# EasyEDA Pro project ProPrj_STM32学习板_2026-09-11.epro, board PCB1
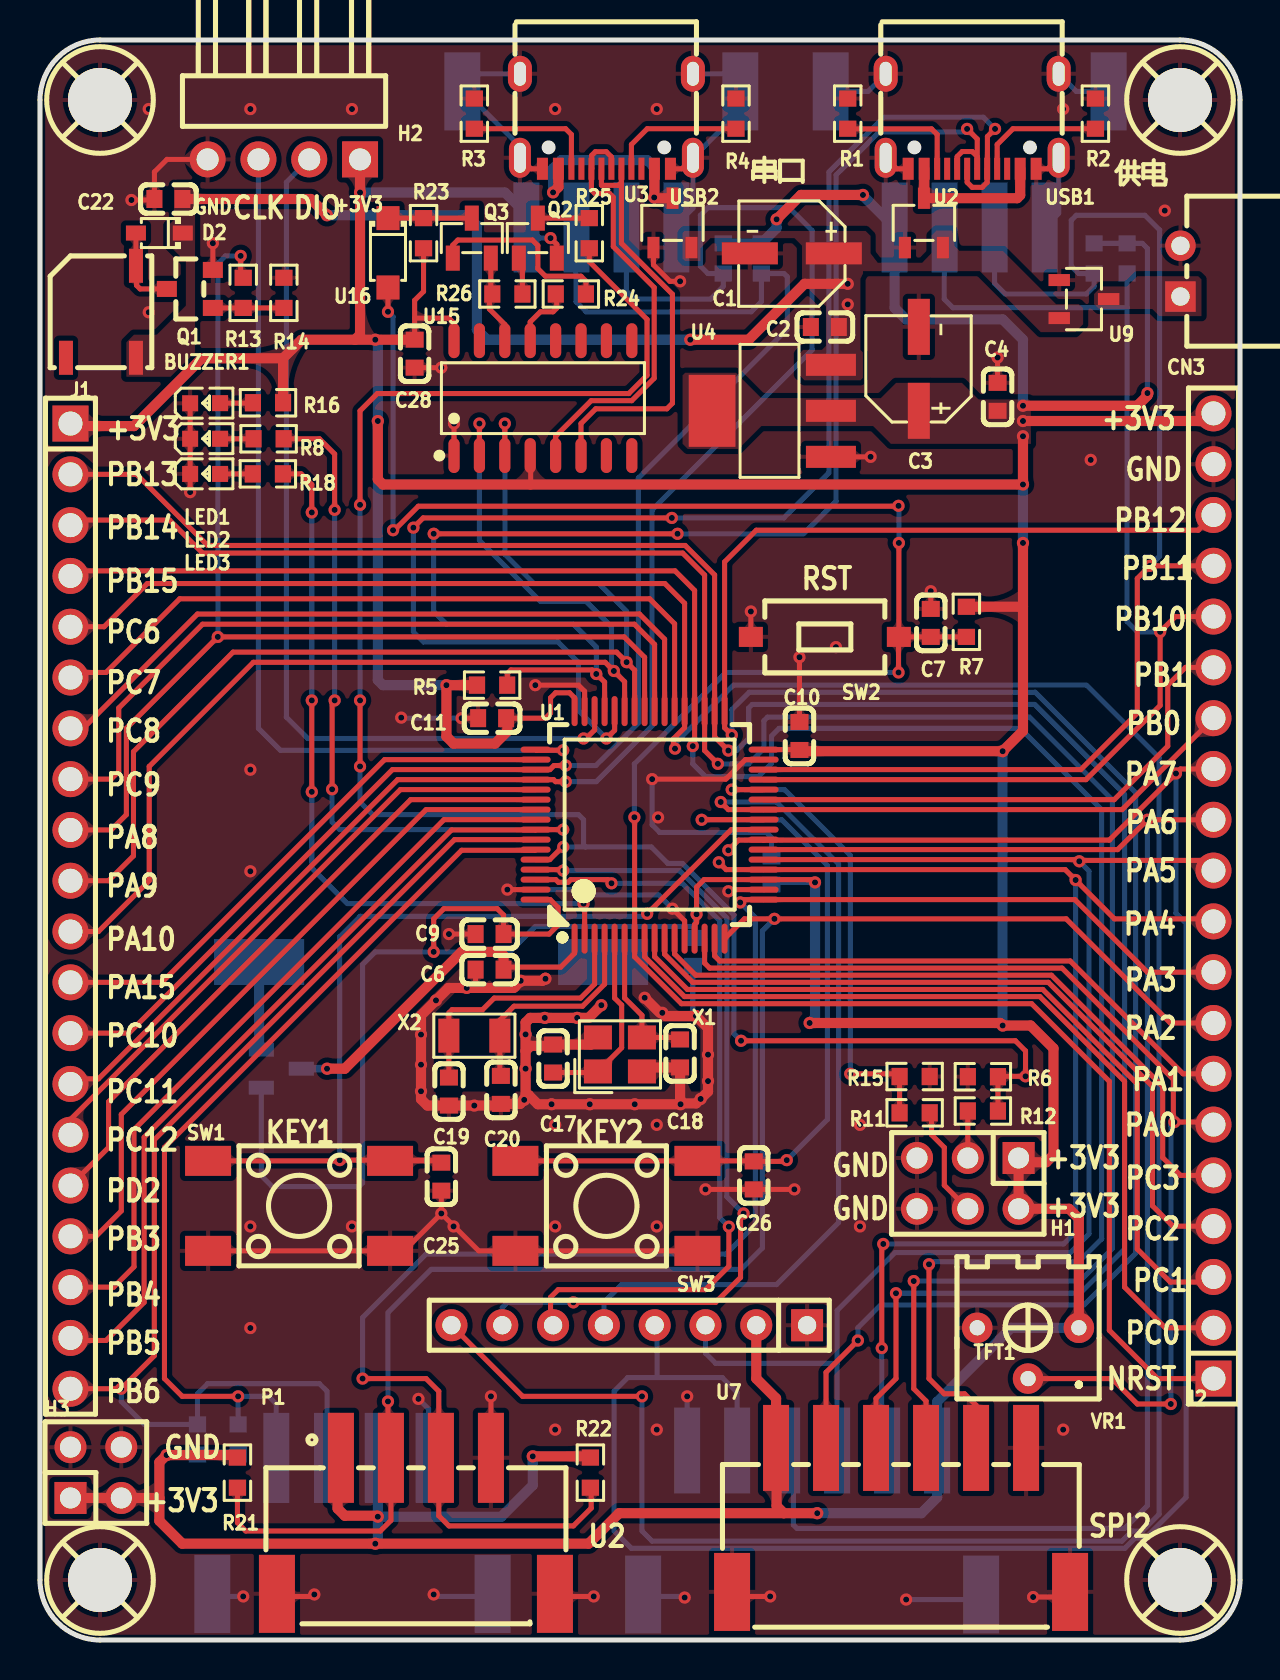
[diagram p3: board, top side]
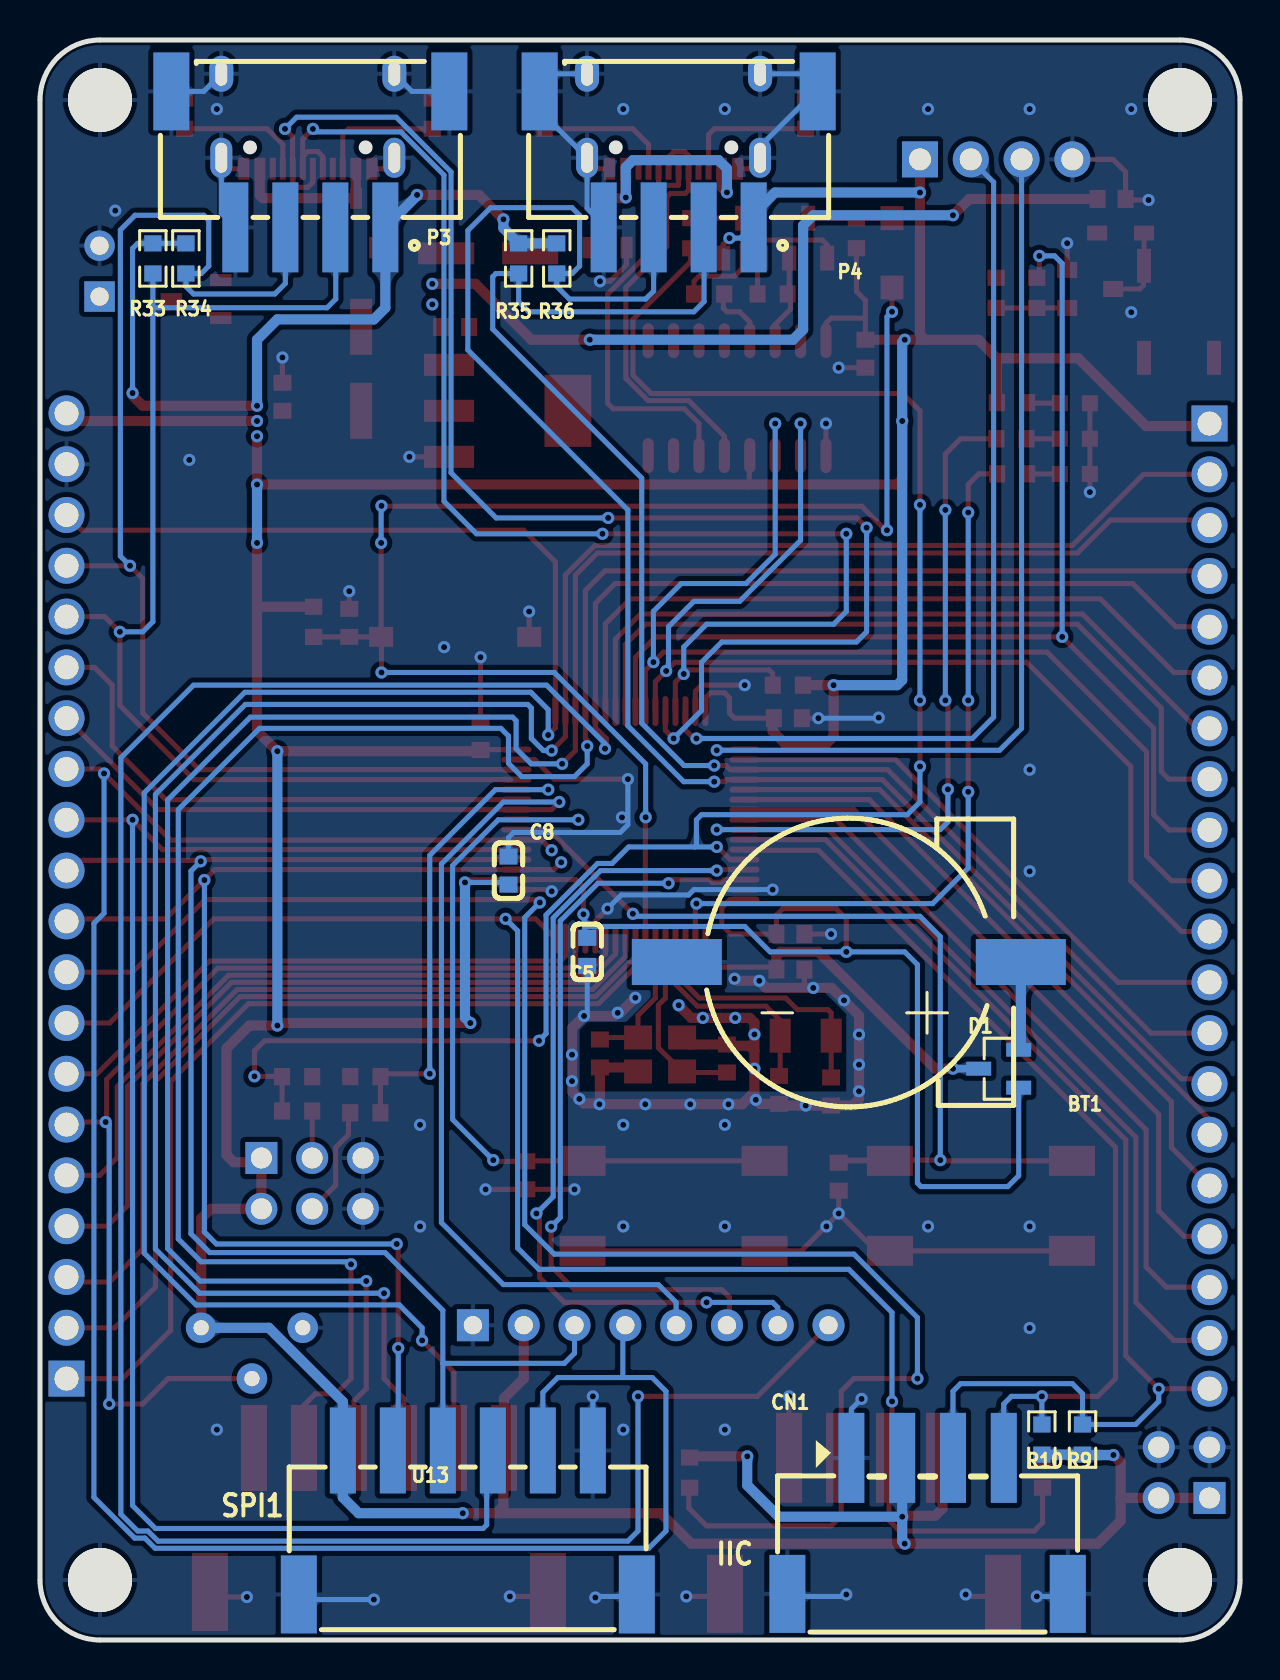
[diagram p4: board, bottom side, seen from below]

Outline 60 x 80 mm; copper layers: Top Layer, Bottom Layer. Coordinates in mm from the lower left corner of the outline.
Outline path: 0,77 0,3 arc(0.88,0.88) 3,0 57,0 arc(59.12,0.88) 60,3 60,77 arc(59.12,79.12) 57,80 3,80 arc(0.88,79.12) 0,77
Stack: Top Layer 0.035mm / Dielectric1 1.51mm FR4 er 4.5 / Bottom Layer 0.035mm

## Design rules (mm)
net USB_D+: DP1
net USB_D-: DP1
net PA9: DP2
net PA10: DP2
spacing copperThickness1oz (default): track to track 0.102, other pairs 0.152 to 0.3
spacing copperThickness2oz: track to track 0.203, other pairs 0.152 to 0.3
track width copperThickness1oz (default): min 0.127, default 0.254, max 2.54
track width copperThickness2oz: min 0.203, default 0.254, max 2.54
differential pair differentialPair (default): width min 0.127, default 0.254, max 2.54; gap min 0.152, default 0.152

## Placement (name value [footprint] x y rotation side)
BT1  CR1220-2ZX  [BAT-SMD_CR1220-2ZX]  19.56 33.9 0 bottom
BUZZER1  4kHz  [BUZ-SMD_L5.0-W5.5-P4.60]  3.05 66.41 90 top
C1  10uF  [CAP-SMD_BD5.0-L5.3-W5.3-LS6.0-FD]  37.59 69.33 180 top
C2  100nF  [C0603]  39.24 65.65 0 top
C3  10uF  [CAP-SMD_BD5.0-L5.3-W5.3-LS6.0-FD]  43.94 63.56 90 top
C4  100nF  [C0603]  47.88 62.16 270 top
C5  100nF  [C0603]  32.64 34.41 90 bottom
C6  100nF  [C0603]  22.48 33.52 180 top
C7  100nF  [C0603]  44.54 50.86 270 top
C8  100nF  [C0603]  36.58 38.47 270 bottom
C9  100nF  [C0603]  22.48 35.3 0 top
C10  100nF  [C0603]  37.97 45.2 270 top
C11  100nF  [C0603]  22.61 46.09 0 top
C17  18pF  [C0603]  25.65 29.07 270 top
C18  18pF  [C0603]  32 29.33 90 top
C19  18pF  [C0603]  20.45 27.42 90 top
C20  18pF  [C0603]  23.04 27.5 90 top
C22  100nF  [C0603]  6.42 72.05 180 top
C25  100nF  [C0603]  20.07 23.17 90 top
C26  100nF  [C0603]  35.69 23.23 90 top
C28  100nF  [C0603]  18.73 64.32 90 top
CN1  XDWF-2500-04P  [CONN-SMD_4P-P2.54_MXXH-2.54-04P-WT1-0-A]  15.62 5.71 180 bottom
CN3  WAFER-XH254WZ-2AM  [CONN-TH_2P-P2.50_WAFER-XH254WZ-2A]  57.02 68.44 90 top
D1  BAT54C  [SOT-23-3_L2.9-W1.3-P1.90-LS2.4-BR]  12.06 28.56 180 bottom
D2  1N5819WS  [SOD-323_L1.8-W1.3-LS2.5-RD]  5.97 70.35 180 top
H1  -  [HDR-TH_6P-P2.54-V-R2-C3-S2.54_A2541WV-2X3P]  46.39 22.83 180 top
H2  PZ254R-11-04P  [HDR-TH_4P-P2.54-H-M-W10.4]  12.19 74.03 180 top
H3  LAIL-PZ2.54-2PX2-L  [HDR-TH_LAIL-PZ2.54-2PX2-L]  2.79 8.37 0 top
J1  2.54-1*20P直针  [HDR-TH_20P-P2.54-V-M-1]  1.52 36.69 270 top
J2  2.54-1*20P直针  [HDR-TH_20P-P2.54-V-M-1]  58.67 37.2 90 top
LED1  NCD0603R1  [LED0603-RD_RED]  8.25 61.84 0 top
LED2  NCD0603C1  [LED0603-RD]  8.25 60.06 0 top
LED3  NCD0603C1  [LED0603-RD]  8.25 58.3 0 top
P1  -  [CONN-SMD_XH2.54-4PSMD]  18.8 5.71 0 top
P3  -  [CONN-SMD_XH2.54-4PSMD]  46.48 74.03 0 bottom
P4  -  [CONN-SMD_XH2.54-4PSMD]  28.07 74.03 0 bottom
Q1  SS8050  [SOT-23_L2.9-W1.3-P1.90-LS2.4-BR]  7.49 67.55 0 top
Q2  S8550  [SOT-23-3_L2.9-W1.3-P1.90-LS2.4-BR]  24.89 70.09 270 top
Q3  S8050  [SOT-23-3_L2.9-W1.3-P1.90-LS2.4-BR]  21.59 70.09 270 top
R1  5.1kΩ  [R0603]  40.39 76.32 90 top
R2  5.1kΩ  [R0603]  52.77 76.32 90 top
R3  5.1kΩ  [R0603]  21.72 76.32 90 top
R4  5.1kΩ  [R0603]  34.8 76.32 90 top
R5  1.5kΩ  [R0603]  22.61 47.74 0 top
R6  100kΩ  [R0603]  47.14 28.16 180 top
R7  10kΩ  [R0603]  46.32 50.91 90 top
R8  1kΩ  [R0603]  11.43 60.06 180 top
R9  4.7kΩ  [R0603]  7.87 10.02 90 bottom
R10  4.7kΩ  [R0603]  9.91 10.02 90 bottom
R11  10K  [R0603]  43.73 26.36 0 top
R12  10K  [R0603]  47.14 26.45 0 top
R13  560Ω  [R0603]  10.16 67.36 270 top
R14  10kΩ  [R0603]  12.19 67.36 90 top
R15  10kΩ  [R0603]  43.73 28.17 180 top
R16  1kΩ  [R0603]  11.4 61.86 180 top
R18  1kΩ  [R0603]  11.39 58.31 180 top
R21  10K  [R0603]  9.87 8.37 90 top
R22  10K  [R0603]  27.52 8.37 90 top
R23  10K  [R0603]  19.18 70.34 270 top
R24  10K  [R0603]  26.54 67.3 0 top
R25  10K  [R0603]  27.47 70.34 90 top
R26  10K  [R0603]  23.37 67.3 0 top
R33  10K  [R0603]  54.36 69.08 90 bottom
R34  10K  [R0603]  52.71 69.08 90 bottom
R35  10K  [R0603]  36.07 69.08 90 bottom
R36  10K  [R0603]  34.16 69.08 90 bottom
SCREW1  -  [M3螺丝]  3 77 0 top
SCREW2  -  [M3螺丝]  57 77 0 top
SCREW3  -  [M3螺丝]  57 3 0 top
SCREW4  -  [M3螺丝]  3 3 0 top
SW1  -  [SW-SMD_4P-L6.0-W6.0-P4.50-LS9.0-2]  12.95 21.71 0 top
SW2  TS-1101-C-W  [SW-SMD_L6.0-W3.3-LS8.0_TS-1101-C-W]  39.24 50.16 180 top
SW3  -  [SW-SMD_4P-L6.0-W6.0-P4.50-LS9.0-2]  28.32 21.71 0 top
TFT1  1.8 TFT 128*RGB*160  [LCD-TH_8P-P2.54-L56.0-W34.0_1.8-TFT]  29.46 15.74 180 top
U1  STM32F103RCT6  [LQFP-64_L10.0-W10.0-P0.50-LS12.0-BL]  30.48 40.76 0 top
U2  CH213K  [SOT-23-3_L2.9-W1.6-P1.90-LS2.8-BR]  44.2 70.86 270 top
U3  CH213K  [SOT-23-3_L2.9-W1.6-P1.90-LS2.8-BR]  31.62 70.86 270 top
U4  AMS1117-3.3  [SOT-223-3_L6.5-W3.4-P2.30-LS7.0-BR]  36.58 61.46 0 top
U7  XH2.54mm-LI-6P  [CONN-SMD_6P-P2.50-H]  43.05 6 0 top
U9  CH213K  [SOT-23-3_L2.9-W1.6-P1.90-LS2.8-BR]  52.2 67.05 180 top
U13  XH2.54mm-LI-6P  [CONN-SMD_6P-P2.50-H]  38.61 5.88 180 bottom
U15  CH340C  [SOP-16_L10.0-W3.9-P1.27-LS6.0-BL]  25.15 62.09 0 top
U16  1N4007W  [SOD-123FL_L2.7-W1.8-LS3.7-RD]  17.4 69.36 270 top
USB1  TYPE-C 16PIN 2MD(073)  [USB-C-SMD_TYPE-C-6PIN-2MD-073]  46.61 75.94 180 top
USB2  TYPE-C 16PIN 2MD(073)  [USB-C-SMD_TYPE-C-6PIN-2MD-073]  28.32 75.94 180 top
VR1  10kΩ  [RES-ADJ-TH_3362P]  49.4 14.34 180 top
X1  8MHz  [CRYSTAL-SMD_4P-L3.2-W2.5-BL]  29 29.28 0 top
X2  32.768kHz  [CRYSTAL-SMD_L3.2-W1.5-1]  21.72 30.22 0 top

## Footprints (pads in the part's own frame, mm; a bottom-side part is the same pattern mirrored in y, then rotated)
BAT-SMD_CR1220-2ZX
  rect 4.5x2.3 smd: 1(-8.6,0) 2(8.6,0)
BUZ-SMD_L5.0-W5.5-P4.60
  rect 1.7x0.7 smd: 1(-2.3,-1.75) 2(2.3,-1.75) 3(-2.3,1.75)
C0603
  rect 0.8x0.9 smd: 1(-0.7,0) 2(0.7,0)
CAP-SMD_BD5.0-L5.3-W5.3-LS6.0-FD
  rect 2.8x1.1 smd: 1(-2.1,0) 2(2.1,0)
CONN-SMD_4P-P2.54_MXXH-2.54-04P-WT1-0-A
  rect 1.3x4.5 smd: 1(-3.809,3.4) 2(-1.27,3.4) 3(1.27,3.4) 4(3.81,3.4)
  rect 1.8x3.9 smd: 5(7.01,-3.4) 6(-7.01,-3.4)
CONN-SMD_6P-P2.50-H
  rect 1.3x4.3 smd: 1(-6.25,3.6) 2(-3.751,3.6) 3(-1.25,3.6) 4(1.25,3.6) 5(3.75,3.6) 6(6.25,3.6)
  rect 1.8x3.9 smd: 7(-8.45,-3.6) 8(8.45,-3.6)
CONN-SMD_XH2.54-4PSMD
  rect 1.3x4.5 smd: 1(-3.75,3.4) 2(-1.25,3.4) 3(1.25,3.4) 4(3.75,3.4)
  rect 1.8x3.9 smd: 5(-6.95,-3.4) 6(6.95,-3.4)
CONN-TH_2P-P2.50_WAFER-XH254WZ-2A
  rect 1.524x1.524 hole 0.914: 1(-1.27,0)
  round 1.524 hole 0.914: 2(1.27,0)
CRYSTAL-SMD_4P-L3.2-W2.5-BL
  rect 1.4x1.2 smd: 1(-1.1,-0.85) 2(1.1,-0.85) 3(1.1,0.85) 4(-1.1,0.85)
CRYSTAL-SMD_L3.2-W1.5-1
  rect 1.05x1.7 smd: 1(-1.275,0) 2(1.275,0)
HDR-TH_4P-P2.54-H-M-W10.4
  rect 1.8x1.8 hole 1.1: 1(-3.81,0)
  round 1.8 hole 1.1: 2(-1.27,0) 3(1.27,0) 4(3.81,0)
HDR-TH_6P-P2.54-V-R2-C3-S2.54_A2541WV-2X3P
  rect 1.6x1.6 hole 1.05: 1(-2.54,-1.27)
  round 1.6 hole 1.05: 2(-2.54,1.27) 3(0,-1.27) 4(0,1.27) 5(2.54,-1.27) 6(2.54,1.27)
HDR-TH_20P-P2.54-V-M-1
  rect 1.8x1.8 hole 1.2: 1(-24.13,0)
  round 1.8 hole 1.2: 2(-21.59,0) 3(-19.05,0) 4(-16.51,0) 5(-13.97,0) 6(-11.43,0) 7(-8.89,0) 8(-6.35,0) 9(-3.81,0) 10(-1.27,0) 11(1.27,0) 12(3.81,0) 13(6.35,0) 14(8.89,0) 15(11.43,0) 16(13.97,0) 17(16.51,0) 18(19.05,0) 19(21.59,0) 20(24.13,0)
HDR-TH_LAIL-PZ2.54-2PX2-L
  rect 1.6x1.6 hole 1.05: 1(-1.27,-1.27)
  round 1.6 hole 1.05: 2(-1.27,1.27) 3(1.27,-1.27) 4(1.27,1.27)
LCD-TH_8P-P2.54-L56.0-W34.0_1.8-TFT
  rect 1.6x1.6 hole 0.914: 1(-8.89,0)
  round 1.6 hole 0.914: 2(-6.35,0) 3(-3.81,0) 4(-1.27,0) 5(1.27,0) 6(3.81,0) 7(6.35,0) 8(8.89,0)
LED0603-RD
  rect 0.8x0.8 smd: 1(-0.749,0) 2(0.749,0)
LED0603-RD_RED
  rect 0.8x0.8 smd: 1(-0.749,-0.004) 2(0.749,0.004)
LQFP-64_L10.0-W10.0-P0.50-LS12.0-BL
  oval 0.3x1.5 smd: 1(-3.75,-5.688) 2(-3.25,-5.688) 3(-2.75,-5.688) 4(-2.25,-5.688) 5(-1.75,-5.688) 6(-1.25,-5.688) 7(-0.75,-5.688) 8(-0.25,-5.688) 9(0.25,-5.688) 10(0.75,-5.688) 11(1.25,-5.688) 12(1.75,-5.688) 13(2.25,-5.688) 14(2.75,-5.688) 15(3.25,-5.688) 16(3.75,-5.688) 33(3.75,5.688) 34(3.25,5.688) 35(2.75,5.688) 36(2.25,5.688) 37(1.75,5.688) 38(1.25,5.688) 39(0.75,5.688) 40(0.25,5.688) 41(-0.25,5.688) 42(-0.75,5.688) 43(-1.25,5.688) 44(-1.75,5.688) 45(-2.25,5.688) 46(-2.75,5.688) 47(-3.25,5.688) 48(-3.75,5.688)
  oval 1.5x0.3 smd: 17(5.7,-3.738) 18(5.7,-3.238) 19(5.7,-2.738) 20(5.7,-2.238) 21(5.7,-1.738) 22(5.7,-1.238) 23(5.7,-0.739) 24(5.7,-0.238) 25(5.7,0.262) 26(5.7,0.762) 27(5.7,1.262) 28(5.7,1.762) 29(5.7,2.261) 30(5.7,2.762) 31(5.7,3.261) 32(5.7,3.762) 49(-5.7,3.762) 50(-5.7,3.261) 51(-5.7,2.762) 52(-5.7,2.261) 53(-5.7,1.762) 54(-5.7,1.262) 55(-5.7,0.762) 56(-5.7,0.262) 57(-5.7,-0.238) 58(-5.7,-0.739) 59(-5.7,-1.238) 60(-5.7,-1.738) 61(-5.7,-2.238) 62(-5.7,-2.738) 63(-5.7,-3.238) 64(-5.7,-3.738)
M3螺丝
  round 3.2 hole 3.2: 1(0,0)
R0603
  rect 0.806x0.864 smd: 1(-0.753,0) 2(0.753,0)
RES-ADJ-TH_3362P
  round 1.524 hole 0.762: 1(-2.54,-1.27) 2(0,1.27) 3(2.54,-1.27)
SOD-123FL_L2.7-W1.8-LS3.7-RD
  rect 1.2x1.15 smd: 1(-1.735,0) 2(1.735,0)
SOD-323_L1.8-W1.3-LS2.5-RD
  rect 1x0.75 smd: 1(-1.173,0) 2(1.173,0)
SOP-16_L10.0-W3.9-P1.27-LS6.0-BL
  oval 0.56x1.745 smd: 1(-4.445,-2.873) 2(-3.175,-2.873) 3(-1.905,-2.873) 4(-0.635,-2.873) 5(0.635,-2.873) 6(1.905,-2.873) 7(3.175,-2.873) 8(4.445,-2.873) 9(4.445,2.873) 10(3.175,2.873) 11(1.905,2.873) 12(0.635,2.873) 13(-0.635,2.873) 14(-1.905,2.873) 15(-3.175,2.873) 16(-4.445,2.873)
SOT-23-3_L2.9-W1.3-P1.90-LS2.4-BR
  rect 1.25x0.7 smd: 1(1,-0.95) 2(1,0.95) 3(-1,0)
SOT-23-3_L2.9-W1.6-P1.90-LS2.8-BR
  rect 1.07x0.6 smd: 1(1.235,-0.95) 2(1.235,0.95) 3(-1.235,0)
SOT-23_L2.9-W1.3-P1.90-LS2.4-BR
  rect 1x0.8 smd: 1(1.15,-0.95) 2(1.15,0.95) 3(-1.15,0)
SOT-223-3_L6.5-W3.4-P2.30-LS7.0-BR
  rect 2.5x1.1 smd: 1(2.97,-2.3) 2(2.97,0) 3(2.97,2.3)
  rect 2.34x3.6 smd: 4(-2.97,0)
SW-SMD_4P-L6.0-W6.0-P4.50-LS9.0-2
  rect 2.3x1.5 smd: 1(-4.55,2.25) 2(4.55,2.25) 3(-4.55,-2.25) 4(4.55,-2.25)
SW-SMD_L6.0-W3.3-LS8.0_TS-1101-C-W
  rect 1.2x1 smd: 1(-3.7,0) 2(3.7,0)
USB-C-SMD_TYPE-C-6PIN-2MD-073
  rect 0.55x1.1 smd: 1(-3.2,2.375) 2(-2.4,2.375) 11(2.4,2.375) 12(3.2,2.375)
  rect 0.3x1.1 smd: 3(-1.75,2.375) 4(-1.25,2.375) 5(-0.75,2.375) 6(-0.25,2.375) 7(0.25,2.375) 8(0.75,2.375) 9(1.25,2.375) 10(1.75,2.375)
  oval 1.1x2 hole 0.6x1.5: 13(-4.325,1.825) 14(4.325,1.825)
  oval 1.2x1.8 hole 0.6x1.2: 13(-4.325,-2.375) 14(4.325,-2.375)

## Nets
As in the schematic.

Pads without a net: BUZZER1 3; U15 7 8 9 10 11 12 15; USB1 3 9; USB2 3 9

## Via types
v1: diameter 0.61, hole 0.305, Top Layer to Bottom Layer, 192 vias

## Routing (per net, layer and track width the routed paths; a pad name or vN(x,y) marks a point on that pad's centre or on a via; arc(x,y) is an arc through that point)
+3V3: length 417
  Top Layer w0.254: 18.73,66.09 20.45,66.09 20.7,65.84 U15.16 ; 18.73,66.09 18.73,66.98 19.18,67.43 R23.2 ; 18.73,66.09 C28.2 ; v1(19.69,34.41) 19.69,36.06 20.19,36.57 22.86,36.57 23.18,36.25 C9.2 25.46,35.3 25.91,35.75 25.91,36.62 25.51,37.02 U1.64 ; 26.73,46.44 26.73,47.11 26.48,47.36 25.78,47.36 25.53,47.11 25.53,46.34 25.27,46.09 C11.2 ; U1.13 32.73,35.78 32.83,35.87 v1(32.83,36.29) 32.83,37.64 33.2,38.02 U1.19 38.61,38.02 v1(38.75,37.88) ; U15.4 24.54,59.2 24.54,57.78 ; v1(25.53,70.09) 25.84,69.78 Q2.2 ; 37.97,44.52 U1.32
  Top Layer w0.508: 36.8,9.6 36.8,12.08 35.81,13.07 TFT1.2 ; 5.97,7.1 5.97,5.96 7.11,4.82 v1(16.76,4.82) 27.43,4.82 28.96,6.34 37.19,6.34 ; 5.97,7.1 5.97,8.89 v1(6.33,9.25) 9.75,9.25 R21.2 ; 5.97,7.1 H3.3 H3.1 ; 58.67,61.33 58.29,60.95 v1(49.15,60.95) ; v1(24.64,9.18) 27.46,9.18 R22.2 ; 37.19,6.34 v1(38.86,6.34) ; 37.19,6.34 36.83,6.7 36.83,9.35 36.8,9.38 ; 51.94,15.61 51.94,21.07 51.45,21.56 48.93,21.56 48.93,24.1 49.14,23.89 50.31,23.89 50.67,24.25 50.67,29.58 49.53,30.72 v1(48.13,30.72) 48.01,30.85 v1(38.48,30.85) ; R5.1 v1(20.32,47.74) 20.32,45.18 20.68,44.82 22.75,44.82 23.37,45.43 23.37,46.03 C11.2 ; 15.75,65.01 13.08,65.01 12.15,64.09 ; 15.75,65.01 v1(16.76,65.01) 18.73,65.01 C28.2 ; 15.75,65.01 16,65.27 v1(16,72.38) H2.1 ; v1(49.15,54.85) 49.15,51.66 ; 49.15,51.66 49.15,45.46 v1(48.13,44.44) 38.05,44.44 37.97,44.52 ; 49.15,51.66 R7.2 ; v1(49.15,61.71) 54.86,61.71 55.37,62.22 v1(55.37,62.35) ; v1(16.89,60.95) 16.89,58.03 17.15,57.78 v1(49.15,57.78) v1(49.15,60.19) ; v1(16.89,6.16) 16.84,6.21 15.24,6.21 14.88,6.57 14.88,8.81 15.05,8.98 ; 12.15,64.09 R16.1 ; 12.15,64.09 8.09,64.09 4.7,60.7 1.65,60.7 J1.1 ; v1(36.83,71.03) 38.05,72.25 v1(41.15,72.25)
  Bottom Layer w0.254: 32.77,35.68 32.77,36.22 v1(32.83,36.29) ; 32.77,35.68 32.77,35.11 ; 32.77,35.68 24.76,35.68 23.5,34.41 v1(19.69,34.41) 16.76,34.41 16.13,33.77 16.13,22.85 15.95,22.67 11.61,22.67 11.06,23.22 D1.1 ; v1(38.75,37.88) 36.68,37.88 C8.2 ; R34.2 R33.2 55.12,69.83 55.37,69.58 v1(55.37,62.35) ; v1(25.53,70.09) 24.98,70.09 24.32,70.76
  Bottom Layer w0.508: v1(16.89,6.16) 16.89,4.94 v1(16.76,4.82) ; v1(16.89,6.16) 23.06,6.16 24.64,7.74 v1(24.64,9.18) ; v1(16.89,6.16) 16.89,8.98 ; v1(6.33,9.25) 7.85,9.25 R9.1 R10.1 ; v1(38.48,30.85) 38.75,31.12 v1(38.75,37.88) ; v1(49.15,61.71) 49.15,65.01 48.13,66.03 43.31,66.03 42.73,66.61 P3.1 41.15,72.22 v1(41.15,72.25) ; v1(20.32,47.74) 17.15,47.74 16.89,48 v1(16.89,60.95) 16.89,64.89 v1(16.76,65.01) ; v1(49.15,57.78) v1(49.15,54.85) ; v1(36.83,71.03) 36.83,70.59 R35.2 R36.2 ; 24.32,70.76 24.32,71.3 23.25,72.38 v1(16,72.38) ; v1(48.13,44.44) v1(48.13,30.72) ; v1(38.86,6.34) 44.07,6.34 44.86,7.13 44.86,11.91 48.56,15.61 51.94,15.61
+5V: length 40.4
  Top Layer w0.508: C22.1 13.54,72.05 v1(14.35,71.24) ; v1(40.39,67.81) 38.23,67.81 35.43,65.01 v1(32.51,65.01)
  Bottom Layer w0.508: v1(32.51,65.01) 22.35,65.01 21.84,65.52 21.84,70.73 21.34,71.24 v1(14.35,71.24)
  vias: v1(40.39,66.78)
GND: length 209.3
  Top Layer w0.254: U3.1 30.67,68.76 31.5,67.94 v1(32,67.94) ; U1.18 34.5,37.52 v1(34.42,37.44) ; v1(7.51,57.39) LED2.1 LED1.1 ; USB2.13 32.1,73.56 USB2.1 ; 34.6,2.18 36.58,2.18 ; v1(4.57,72) 5.67,72 C22.2 5.72,73.4 6.35,74.03 H2.4 ; 22.55,8.98 v1(22.55,12.18) ; v1(49.66,2.15) 51.47,2.15 51.5,2.18 ; v1(30.61,43.04) 34.28,43.04 34.34,43.1 34.35,43.1 35.27,44.02 U1.31 ; 21.78,32.6 C6.2 ; 11.85,2.18 13.62,2.18 v1(13.72,2.28) ; USB1.14 42.83,73.56 43.41,73.56 ; SW3.4 SW3.3 21.94,19.46 v1(20.07,21.33) ; SW2.2 v1(35.54,51.42) ; C25.1 v1(20.07,21.33) ; v1(20.07,21.33) 18.2,19.46 SW1.4 SW1.3 ; v1(31.62,36.57) 32.23,35.96 U1.12 ; C9.1 v1(20.45,35.3) ; v1(33.27,22.53) v1(37.72,22.53) ; U1.63 v1(23.37,37.52) ; C28.1 v1(20.07,63.62) ; C4.1 v1(47.88,64.12) ; USB2.14 24.55,73.56 USB2.12 ; Q1.2 v1(8.64,69.84) ; U15.1 v1(20.7,60.82) ; 27.23,46.44 27.23,47.44 26.92,47.74 v1(24.76,47.74) ; USB1.13 50.38,73.56 USB1.1 ; C11.1 v1(21.08,46.09) ; C7.1 v1(44.54,52.44) ; 25.75,2.18 v1(27.69,2.18) ; C10.1 v1(37.97,49.14) ; U4.1 v1(41.53,59.16)
  Top Layer w0.508: 24.44,27.24 24.01,26.81 C20.1 22.96,26.72 v1(21.71,26.72) C19.1 19.37,26.72 19.05,27.04 v1(19.05,27.44) v1(19.05,28.77) v1(19.05,30.27) 19.05,31.23 v1(19.8,31.98) 20.42,32.6 v1(21.34,32.6) 23.68,32.6 23.74,32.66 23.75,32.66 23.99,32.9 23.99,32.91 v1(24.04,32.96) 25.12,32.96 25.27,33.11 ; 24.44,27.24 24.89,26.79 v1(25.58,26.79) v1(27.49,26.79) v1(29.74,26.79) v1(32.03,26.79) 32.03,26.83 ; 24.44,27.24 24.31,27.24 24.28,27.27 v1(24.28,28.57) 24.28,29.45 ; X1.2 30.3,28.63 C18.1 32,27.02 32.03,27.02 32.03,26.83 ; 27.9,30.13 27.54,29.77 C17.1 25.59,29.71 24.53,29.71 24.28,29.45 ; 24.28,29.45 v1(24.28,30.28) 24.28,30.87 24.51,31.11 v1(25.24,31.11) v1(26.86,31.11) 27.43,31.11 v1(28.07,31.74) ; 32.03,26.83 32.81,26.83 v1(33.03,27.05) 33.4,27.42 v1(33.4,27.94) v1(33.4,29.27) 33.4,30.6 v1(32.8,31.2) 31.27,31.2 v1(31.12,31.36) ; 30.99,31.36 v1(30.23,32.11)
  Bottom Layer w0.254: v1(36.51,2.18) 36.4,2.18 ; USB2.14 24,74.68 21.12,77.56 ; 8.61,2.18 v1(10.16,2.18) ; v1(21.08,46.09) 18.09,46.09 v1(18.06,46.12) ; v1(19.69,2.28) 19.78,2.18 22.63,2.18 ; 32.36,9.38 v1(32.36,12.18) ; v1(30.61,43.04) 30.61,40.76 30.99,40.38 36.32,40.38 36.58,40.12 C8.1 ; USB2.14 20.97,78.31 20.79,78.13 20.79,77.88 20.93,77.73 21.29,77.73 ; v1(18.92,12.06) 19.43,11.55 19.43,8.98 ; USB2.13 34.26,78.31 35.02,77.56 35.02,76.48 USB2.13 32.65,71.59 31.82,70.76 ; P3.5 41.4,77.43 USB1.14 ; v1(43.31,2.02) 46.9,2.02 47.06,2.18 ; P3.4 50.93,71.33 USB1.13 ; v1(32.23,2.12) 32.18,2.18 30.16,2.18 ; v1(32.8,31.2) 32.64,31.36 C5.1 ; v1(23.37,37.52) 27.31,37.52 27.57,37.25 30.94,37.25 v1(31.62,36.57) ; USB1.13 51.81,77.43 P3.6
  vias: v1(5.44,76.55) v1(5.44,66.39) v1(10.52,76.55) v1(10.52,43.52) v1(10.52,38.44) v1(10.52,20.68) v1(10.52,15.6) v1(15.6,76.55) v1(15.6,20.68) v1(20.68,20.68) v1(24.21,27.01) v1(25.27,33.06) v1(25.76,76.55) v1(25.76,25.76) v1(25.76,20.68) v1(25.76,10.52) v1(30.84,76.55) v1(30.84,25.76) v1(30.84,20.68) v1(30.84,10.52) v1(30.9,41.13) v1(39.79,49.64) v1(41,25.76) v1(41,20.68) v1(51.16,76.55) v1(51.16,10.52) v1(52.54,59.01) v1(56.24,71.47)
VBUS1: length 7.7
  Top Layer w0.508: USB1.2 49.01,72.24 48.86,72.09 U2.3 44.21,72.1 USB1.11
VBUS2: length 11.7
  Top Layer w0.508: U3.3 30.75,72.09 v1(30.71,72.13) 30.72,72.14 USB2.2 ; USB2.11 25.92,72.65 v1(25.65,72.38)
  Bottom Layer w0.508: v1(30.71,72.13) 30.71,72.13 30.71,73.63 30.35,73.99 26.07,73.99 25.65,73.58 v1(25.65,72.38)
ADC_EXT0: length 43.1
  Top Layer w0.254: U1.8 30.23,34.16 32.22,32.17 49.99,32.17 54.23,27.93 54.23,17.64 56.26,15.61 J2.2
ADC_EXT1: length 40.5
  Top Layer w0.254: 58.67,18.15 58.42,17.9 56.51,17.9 54.86,19.55 54.86,27.8 50.14,32.53 32.37,32.53 30.73,34.17 U1.9
ADC_EXT2: length 37.4
  Top Layer w0.254: J2.4 56.64,20.69 55.63,21.71 55.63,27.68 50.42,32.88 32.64,32.88 31.23,34.29 U1.10
ADC_EXT3: length 34.4
  Top Layer w0.254: U1.11 31.73,34.3 32.79,33.24 50.57,33.24 56.13,27.68 56.13,24.12 57.02,23.23 J2.5
ADC_EXT4: length 28.2
  Top Layer w0.254: U1.15 33.73,34.2 33.98,33.95 51.51,33.95 57.15,28.31 J2.7
ADC_POT: length 53.1
  Top Layer w0.254: VR1.2 53.59,13.07 54.86,11.8 v1(56.54,11.8) ; 58.67,25.77 58.55,25.9 56.67,25.9 56.67,28.03 51.1,33.59 33.48,33.59 33.23,33.85 U1.14
  Bottom Layer w0.254: v1(56.54,11.8) 56.54,25.77 56.67,25.9
  vias: v1(56.72,25.9)
AUX_PA15: length 27.9
  Top Layer w0.254: J1.12 6.1,32.88 17.23,44.02 U1.50
AUX_PB0: length 66.3
  Top Layer w0.254: v1(34.04,41.9) 34.42,41.52 U1.26 54.1,41.52 J2.14
  Bottom Layer w0.254: v1(34.04,41.9) 36.83,41.9 39.93,38.8 39.93,20.87 36.83,17.77 29.08,17.77 28.19,16.88 TFT1.5
AUX_PB1: length 27
  Top Layer w0.254: J2.15 57.28,48.63 56.39,47.74 56.39,44.69 53.71,42.02 U1.27
AUX_PB3: length 34.9
  Top Layer w0.254: U1.55 19.3,41.52 4.06,26.28 4.06,21.45 2.79,20.18 J1.17
AUX_PB4: length 37
  Top Layer w0.254: J1.18 3.68,17.64 4.7,18.66 4.7,25.52 20.2,41.02 U1.56
BOOT0: length 92
  Top Layer w0.254: v1(26.16,39.65) 26.12,39.65 25.49,39.02 U1.60 ; R12.2 R6.1 47.92,28.18 v1(49.28,28.18) 49.28,29.45 48.77,29.96 v1(35.05,29.96) ; v1(16,46.98) v1(16,43.68) ; v1(16,56.76) 16,61.46 16.87,62.32 29.44,62.32 30.35,63.24 30.35,66.03 27.47,68.92 R25.1
  Bottom Layer w0.254: 27.27,39.65 27.18,39.74 27.18,41.01 26.92,41.27 16.64,41.27 16,41.9 v1(16,43.68) ; 27.27,39.65 v1(26.16,39.65) ; 27.27,39.65 30.57,39.65 31.39,38.83 32.12,38.83 34.7,36.25 34.7,30.32 v1(35.05,29.96) ; v1(16,56.76) v1(16,46.98)
BOOT1: length 24.1
  Top Layer w0.254: 42.98,26.36 42.98,28.17 42.84,28.31 v1(40.51,28.31) ; 36.18,42.52 v1(34.59,42.52)
  Bottom Layer w0.254: v1(40.51,28.31) 40.51,39.23 37.23,42.52 v1(34.59,42.52)
BUZZ_PWM: length 59.5
  Top Layer w0.254: 30.23,46.44 30.23,49.14 29.21,50.16 v1(8.89,50.16) 4.32,45.58 4.32,41.27 3.56,40.5 J1.9 ; v1(10.03,69.2) 10.03,68.24 R13.1
  Bottom Layer w0.254: v1(8.89,50.16) 8.89,68.82 9.27,69.2 v1(10.03,69.2)
DTR: length 3.3
  Top Layer w0.254: U15.13 24.51,65.9 25.02,66.41 25.65,66.41 25.83,66.59 25.83,67.26 R24.1
GPIO_PB8: length 42.4
  Top Layer w0.254: v1(26.67,16.88) 33.78,16.88 35.03,18.13 35.03,21.17 v1(35.18,21.33) ; U1.61 26.11,38.52 v1(26.16,38.47)
  Bottom Layer w0.254: v1(26.16,38.47) 31.97,38.47 34.34,36.1 34.34,22.16 v1(35.18,21.33) ; TFT1.7 23.11,16.63 23.37,16.88 v1(26.67,16.88)
GPIO_PB9: length 38.6
  Top Layer w0.254: v1(34.44,20.67) 34.44,18.68 33.27,17.52 25.91,17.52 25.53,17.13 25.53,15.87 TFT1.6 ; v1(28.57,37.84) 28.39,38.02 26.54,38.02 26.4,37.89 25.92,37.89 25.79,38.02 U1.62
  Bottom Layer w0.254: v1(28.57,37.84) 32.1,37.84 33.99,35.96 33.99,21.12 v1(34.44,20.67)
I2C1_SCL: length 57.7
  Top Layer w0.254: J1.20 v1(4.06,12.56) 5.72,14.21 5.72,25.01 20.72,40.02 U1.58
  Bottom Layer w0.254: v1(4.06,12.56) 4.06,11.93 5.22,10.78 R9.2 7.87,12.31 8.38,12.82 13.97,12.82 14.35,12.44 14.35,8.98
I2C1_SDA: length 46.6
  Top Layer w0.254: v1(9.91,12.18) 7.11,12.18 6.22,13.07 6.22,24.63 21.08,39.49 24.75,39.49 U1.59
  Bottom Layer w0.254: 11.81,8.98 11.81,11.8 11.43,12.18 v1(9.91,12.18) R10.2
KEY1: length 48.8
  Top Layer w0.254: U1.24 34.56,40.52 v1(30.36,36.31) ; SW1.1 14.95,23.96 v1(14.99,23.99) 19.94,23.99 19.98,23.96 ; 19.98,23.96 C25.2 ; 19.98,23.96 SW1.2
  Bottom Layer w0.254: v1(30.36,36.31) 30.23,36.19 16,36.19 14.99,35.17 v1(14.99,23.99)
KEY2: length 39.5
  Top Layer w0.254: v1(37.34,23.99) 37.28,23.93 C26.2 ; v1(33.08,41.01) 33.09,41.02 U1.25 ; SW3.1 32.87,23.96 ; SW3.2 35.66,23.96
  Bottom Layer w0.254: v1(37.34,23.99) 39.37,26.03 39.37,38.72 37.08,41.01 v1(33.08,41.01)
LED2: length 73.1
  Top Layer w0.254: v1(14.6,42.53) 14.6,46.85 v1(14.73,46.98) ; v1(26.16,40.52) U1.57 24.76,40.5 20.57,40.5 5.21,25.14 5.21,16.88 3.3,14.98 1.65,14.98 J1.19 ; v1(14.73,56.5) 14.73,59.3 13.97,60.06 R8.1
  Bottom Layer w0.254: v1(26.16,40.52) 14.99,40.52 14.6,40.9 v1(14.6,42.53) ; v1(14.73,56.5) v1(14.73,46.98)
NRST: length 119.5
  Top Layer w0.254: R7.1 C7.2 42.94,50.16 ; v1(17.4,66.41) U16.2 ; 42.94,50.16 42.93,50.14 v1(42.93,48.38) ; 42.94,50.16 v1(42.94,54.85) ; v1(17.65,55.49) 17.72,55.49 18.91,56.69 42.91,56.69 v1(42.93,56.71) ; J2.1 55.88,13.07 53.47,15.48 53.47,27.93 49.58,31.81 32.07,31.81 29.73,34.16 U1.7 29.73,41.13 v1(29.72,41.14)
  Bottom Layer w0.254: v1(42.93,48.38) 34.29,48.38 29.72,43.81 v1(29.72,41.14) ; v1(42.93,56.71) 42.94,56.69 v1(42.94,54.85) ; v1(17.4,66.41) 17.65,66.16 v1(17.65,55.49)
OSC32_IN: length 13.4
  Top Layer w0.254: U1.3 27.73,32.8 27.03,32.1 22.71,32.1 22.13,31.52 20.6,31.52 20.44,31.35 X2.1 20.44,28.13 C19.2
OSC32_OUT: length 11.1
  Top Layer w0.254: C20.2 22.99,28.26 X2.2 22.99,30.98 23.7,31.69 27.13,31.69 28.23,32.79 U1.4
OSC_IN: length 9.5
  Top Layer w0.254: C17.2 27.84,28.37 29.08,29.61 29.08,31.74 28.73,32.1 U1.5
OSC_OUT: length 7.2
  Top Layer w0.254: U1.6 29.23,32.1 30.1,31.23 X1.3 31.9,30.13 C18.2
PA2: length 84
  Top Layer w0.254: J2.8 56.51,30.85 51.31,36.06 v1(36.72,36.06) 35.22,36.06 U1.16 ; R21.1 9.87,5.87 10.29,5.45 17.02,5.45 17.55,5.98 17.55,8.98 17.4,9.12 v1(17.4,11.93)
  Bottom Layer w0.254: v1(36.72,36.06) 36.12,35.46 36.12,19.6 35.05,18.53 19.56,18.53 17.4,16.37 v1(17.4,11.93)
PA3: length 85.9
  Top Layer w0.254: v1(16.13,13.07) 19.3,13.07 19.94,12.44 19.94,9.09 20.05,8.98 19.94,8.87 19.94,6.21 20.45,5.71 26.67,5.71 27.56,6.59 27.56,7.57 R22.1 ; v1(35.01,36.88) 35.15,37.02 U1.17 51.74,37.02 55.37,33.39 58.67,33.39
  Bottom Layer w0.254: v1(35.01,36.88) 35.76,36.12 35.76,20.77 34.29,19.29 19.3,19.29 16.13,16.12 v1(16.13,13.07)
PA4: length 64
  Top Layer w0.254: J2.10 58.55,36.06 53.72,36.06 v1(51.78,38) 51.26,38.52 U1.20 34.31,38.52 v1(33.94,38.88) ; v1(42.16,19.8) 42.09,19.73 v1(42.09,14.59)
  Bottom Layer w0.254: 42.36,9.38 42.09,9.65 v1(42.09,14.59) ; v1(51.78,38) 51.78,20.4 51.18,19.8 v1(42.16,19.8)
PA5: length 71.1
  Top Layer w0.254: 58.67,38.47 58.17,38.98 52.01,38.98 v1(51.96,38.94) 51.88,39.02 U1.21
  Bottom Layer w0.254: TFT1.3 33.27,14.34 33.78,13.83 39.86,13.83 ; 39.86,13.83 39.86,9.38 ; 39.86,13.83 39.86,16.48 42.75,19.37 51.51,19.37 52.45,20.31 52.45,38.45 v1(51.96,38.94)
PA6: length 79.4
  Top Layer w0.254: J2.12 v1(55.37,41.01) 53.88,39.52 U1.22
  Bottom Layer w0.254: 37.36,9.38 37.67,9.07 37.67,5.76 37.85,5.58 54.23,5.58 55.37,6.72 v1(55.37,41.01)
PA7: length 111.6
  Top Layer w0.254: v1(34.42,39.49) 34.93,40 36.16,40 U1.23 36.2,40 53.47,40 v1(56.8,43.33) 57.02,43.55 58.67,43.55
  Bottom Layer w0.254: 30.48,15.49 30.86,15.11 30.86,13.12 ; 30.86,13.12 29.39,13.12 28.7,12.44 28.7,5.45 29.57,4.59 54.25,4.59 54.75,5.09 55.27,5.09 57.3,7.13 57.3,35.84 56.8,36.34 v1(56.8,43.33) ; 30.86,13.12 34.11,13.12 34.86,12.38 34.86,9.38
PA9: length 56.6
  Top Layer w0.254: v1(23.24,60.82) 23.24,58.97 ; J1.10 3.43,37.96 4.67,39.21 4.67,44.42 9.65,49.39 28.83,49.39 v1(29.33,48.89) 29.73,48.49 29.73,46.44
  Bottom Layer w0.254: v1(23.24,60.82) 23.24,54.29 24.7,52.82 27.94,52.82 29.33,51.43 v1(29.33,48.89)
PA10: length 56.9
  Top Layer w0.254: 29.23,46.44 29.23,47.91 v1(28.69,48.45) 28.26,48.89 10.67,48.89 5.46,43.68 5.46,37.96 2.92,35.42 J1.11 ; v1(21.97,60.82) 21.97,58.97
  Bottom Layer w0.254: v1(28.69,48.45) 28.57,48.57 28.57,50.66 27.31,51.93 25.02,51.93 21.97,54.98 v1(21.97,60.82)
PA11: length 71.4
  Top Layer w0.254: v1(18.67,55.62) 19.16,56.1 v1(31.59,56.1) ; USB1.7 46.36,72.88 46.61,72.63 47.11,72.63 47.36,72.88 USB1.5 47.37,73.57 47.37,75.17 v1(47.75,75.56) ; 28.73,46.44 28.73,45.48 v1(28.32,45.08)
  Bottom Layer w0.254: v1(28.32,45.08) 26.92,46.47 26.92,48.89 25.91,49.9 19.18,49.9 18.67,50.41 v1(18.67,55.62) ; v1(47.75,75.56) 47.17,76.14 42.19,76.14 39.45,73.4 39.45,58.36 37.19,56.1 v1(31.59,56.1)
PA12: length 70
  Top Layer w0.254: R5.2 23.37,47.75 23.37,48.32 23.55,48.5 27.61,48.5 v1(27.81,48.3) 27.82,48.3 28.23,47.9 28.23,46.44 ; USB1.6 46.86,73.56 46.86,74.17 ; 46.86,74.17 46.61,74.42 46.11,74.42 45.86,74.17 USB1.8 ; 46.86,74.17 46.86,75.05 v1(46.35,75.56) ; v1(31.88,55.31) v1(19.69,55.31)
  Bottom Layer w0.254: v1(19.69,55.31) 19.69,51.42 20.32,50.79 26.67,50.79 27.81,49.65 v1(27.81,48.3) ; v1(31.88,55.31) 38.18,55.31 39.8,56.94 39.8,73.25 41.96,75.41 46.21,75.41 v1(46.35,75.56)
PA13: length 45.4
  Top Layer w0.254: 27.73,46.44 27.73,45.5 27.24,45.01 v1(27.18,45.08)
  Bottom Layer w0.254: v1(27.18,45.08) 13.39,45.08 12.32,46.14 12.32,72.89 H2.2
PA14: length 45.5
  Top Layer w0.254: U1.49 24.81,44.49 v1(26.16,44.49)
  Bottom Layer w0.254: H2.3 10.92,45.58 12.02,44.49 v1(26.16,44.49)
PB10: length 60.7
  Top Layer w0.254: U1.29 52.3,43.02 56.01,46.73 v1(56.01,50.41) 56.77,51.17 58.67,51.17
  Bottom Layer w0.254: 54.36,66.61 54.36,50.92 54.86,50.41 v1(56.01,50.41) ; 54.36,66.61 45.65,66.61 45.21,67.05 45.21,68.46 45.72,68.97 45.72,70.27 45.56,70.44 45.43,70.44 P3.2 ; 54.36,66.61 R33.1
PB11: length 64.9
  Top Layer w0.254: U1.30 52.04,43.52 54.86,46.34 54.86,53.08 v1(55.5,53.71) J2.17
  Bottom Layer w0.254: P3.3 47.73,67.83 48.26,67.3 52.32,67.3 52.71,67.68 R34.1 51.93,68.32 51.56,68.7 51.56,70.98 51.82,71.24 55.25,71.24 55.98,70.5 55.98,54.19 v1(55.5,53.71)
PB12: length 103.5
  Top Layer w0.254: 58.67,56.25 57.91,55.49 35.81,55.49 34.23,53.91 34.23,45.61 v1(34.59,45.25) ; v1(40.89,14.98) 39.3,13.38 39.3,9.38
  Bottom Layer w0.254: v1(40.89,14.98) 40.89,15.61 42.04,16.75 52.2,16.75 54.79,19.34 54.79,42.36 49.76,47.39 35.46,47.39 34.59,46.52 v1(34.59,45.25)
PB13: length 110.3
  Top Layer w0.254: 41.8,9.38 41.8,12.07 42.8,13.07 v1(42.8,17.34) ; v1(34.42,44.47) 33.73,45.16 33.73,53.25 32.26,54.73 8.38,54.73 4.83,58.28 J1.2
  Bottom Layer w0.254: v1(34.42,44.47) 34.83,44.47 35.43,45.08 35.43,46.6 35.61,46.78 49.73,46.78 54.23,42.28 54.23,19.55 52.02,17.34 v1(42.8,17.34)
PB14: length 107.7
  Top Layer w0.254: J1.3 1.78,56 6.48,56 8.13,54.35 32.13,54.35 33.23,53.25 33.23,44.47 v1(33.89,43.81) ; 44.3,9.38 44.3,11.95 43.69,12.56 v1(43.69,17.95)
  Bottom Layer w0.254: v1(33.89,43.81) 35.44,43.81 36.19,44.57 36.19,45.96 36.37,46.14 49.48,46.14 53.62,42 53.62,19.57 51.99,17.95 v1(43.69,17.95)
PB15: length 106.2
  Top Layer w0.254: v1(32.64,44.69) 32.64,44.98 32.73,45.07 32.73,52.48 31.75,53.46 1.78,53.46 J1.4 ; 46.8,9.38 46.8,11.73 46.23,12.31 45.21,12.31 44.45,13.07 v1(44.45,18.79)
  Bottom Layer w0.254: v1(44.45,18.79) 44.58,18.91 51.94,18.91 53.09,20.06 53.09,41.52 49.02,45.58 36.96,45.58 36.58,45.2 36.58,43.83 35.91,43.17 33.27,43.17 32.64,43.81 v1(32.64,44.69)
PC6: length 148.9
  Top Layer w0.254: J1.5 3.2,50.66 5.36,52.82 31.24,52.82 32.23,51.83 32.23,45.62 31.67,45.06 31.67,44.64 v1(31.75,44.57) ; TFT1.8 24.13,12.18 v1(30.1,12.18)
  Bottom Layer w0.254: v1(31.75,44.57) 31.75,44.82 34.67,47.74 52.32,47.74 55.96,44.11 55.96,6.29 55.12,5.45 54.61,5.45 54.1,4.94 30.61,4.94 30.1,5.45 v1(30.1,12.18)
PC7: length 36.7
  Top Layer w0.254: 1.52,48.12 1.78,48.38 3.3,48.38 6.98,52.06 30.48,52.06 31.73,50.81 31.73,46.44
PC8: length 36.2
  Top Layer w0.254: J1.7 2.16,45.58 7.87,51.3 29.97,51.3 31.23,50.04 31.23,46.44
PC9: length 38
  Top Layer w0.254: 1.52,43.04 3.56,43.04 3.94,43.42 3.94,46.6 8.13,50.79 29.72,50.79 30.73,49.78 30.73,46.44
PC10: length 76.5
  Top Layer w0.254: J1.13 4.44,30.34 17.62,43.52 U1.51 25.5,43.52 25.7,43.72 v1(26.29,43.72)
  Bottom Layer w0.254: v1(26.29,43.72) 27.8,43.72 29.91,45.84 29.91,58.1 37.36,65.55 37.36,68.16 37.2,68.32 R35.1 36.07,66.92 35.56,66.41 27.31,66.41 26.8,66.92 26.8,70.74 26.82,70.76
PC11: length 84
  Top Layer w0.254: J1.14 1.78,28.06 2.92,28.06 17.88,43.02 U1.52 25.68,43.02 25.78,42.92 v1(26.29,42.92)
  Bottom Layer w0.254: 29.32,70.76 29.32,67.45 29.72,67.05 33.53,67.05 34.16,67.68 R36.1 33.39,68.32 33.02,68.7 33.02,71.24 33.4,71.62 37.47,71.62 38.61,70.47 38.61,64.51 30.61,56.5 30.61,45.71 27.81,42.92 v1(26.29,42.92)
PC12: length 30.9
  Top Layer w0.254: U1.53 18.02,42.52 1.52,26.03 J1.15
PC13: length 36.9
  Top Layer w0.254: v1(13.59,46.98) v1(13.59,42.41) ; v1(27.18,36.82) 27.23,36.77 U1.2 ; v1(13.59,56.38) 13.59,57.78 13.06,58.31 R18.1
  Bottom Layer w0.254: v1(27.18,36.82) 15.37,36.82 13.59,38.6 v1(13.59,42.41) ; v1(13.59,56.38) v1(13.59,46.98)
PD2: length 32.6
  Top Layer w0.254: U1.54 18.53,42.02 3.43,26.91 3.43,24.63 J1.16
RTS: length 4.5
  Top Layer w0.254: Q3.2 22.54,67.37 22.47,67.3 22.47,66.55 23.24,65.78 U15.14
USB_D+: length 21.7
  Top Layer w0.254: U15.5 25.78,60.19 27.56,61.97 29.59,61.97 30.71,63.09 30.71,67.63 28.66,69.67 28.66,72.14 28.48,72.33 27.74,72.33 27.57,72.5 USB2.8 27.59,73.58 27.59,74.23 27.76,74.41 28.31,74.41 28.57,74.16 USB2.6
USB_D-: length 21.3
  Top Layer w0.254: 29.07,72.88 29.07,69.84 31.62,67.29 31.62,61.84 31.34,61.56 27.79,61.56 27.05,60.82 U15.6 ; 29.07,72.88 28.93,72.73 28.09,72.73 28.07,72.75 USB2.7 ; 29.07,72.88 USB2.5
$1N22: length 1.6
  Top Layer w0.254: R18.2 10.63,58.3 LED3.2
$1N26: length 1.7
  Top Layer w0.254: LED1.2 10.62,61.84 R16.2
$1N36: length 17.8
  Top Layer w0.254: U1.1 26.73,34.34 26.03,33.64 23.31,33.64
  Top Layer w0.508: v1(14.35,28.56) 15.24,28.56 21.08,34.41 22.99,34.41 23.18,34.22 C6.1
  Bottom Layer w0.381: D1.3 v1(14.35,28.56)
$1N38: length 4.4
  Bottom Layer w0.508: BT1.1 10.96,29.62 D1.2
$1N120: length 5.6
  Top Layer w0.254: H1.4 45.22,22.74 45.22,24.62 44.58,25.26 44.58,26.27 R11.2
$1N122: length 2.3
  Top Layer w0.254: R12.1 H1.3
$1N130: length 6.8
  Top Layer w0.254: R4.1 30.36,75.56 29.57,74.77 USB2.4
$1N136: length 6.7
  Top Layer w0.254: R3.1 26.28,75.56 26.57,75.27 USB2.10
$1N144: length 1.7
  Top Layer w0.254: R8.2 9.13,60.06 9,60.19
$2N11: length 6.5
  Top Layer w0.254: R2.1 48.65,75.56 47.86,74.77 USB1.4
$2N17: length 6.3
  Top Layer w0.254: USB1.10 44.86,75.27 44.58,75.56 40.39,75.56 R1.1
$3N15: length 3.5
  Top Layer w0.254: Q1.1 R13.2 R14.1
$3N16: length 4.2
  Top Layer w0.254: 6.34,67.55 5.01,67.55 4.83,67.73 4.83,68.68 BUZZER1.2 4.8,70.35
$3N73: length 1.9
  Top Layer w0.254: R26.2 24.12,68.91 Q2.1
$3N74: length 2.3
  Top Layer w0.254: Q2.3 27.21,71.09
$3N75: length 9.6
  Top Layer w0.254: Q3.1 20.64,69.74 20.89,70 24.62,70 24.89,69.72 24.89,68.57 25.27,68.19 27.05,68.19 27.3,67.94 R24.2
$3N77: length 4.2
  Top Layer w0.254: U16.1 R23.1 Q3.3

## Copper pours and planes (outline as drawn; the poured copper is in the pictures)
+3V3 on Top Layer: 32.13,63.36 49.55,63.36 49.55,59.55 32.13,59.55
+5V on Top Layer: 32.13,70.48 52.16,70.48 52.16,62.98 32.13,62.98
+5V on Top Layer: 4.32,72.76 7.75,72.76 7.75,63.16 4.32,63.16
GND on Top Layer: -10.92,82.67 73.41,82.67 73.41,-7.38 -10.92,-7.38
GND on Bottom Layer: -16.26,85.84 86.61,85.84 86.61,-10.42 -16.26,-10.42
VBUS3 on Top Layer: 52.71,68.19 58.08,68.19 58.08,66.19 52.71,66.19

Small or netless copper shapes (teardrops, artwork), in the pictures only: 511 on Top Layer, 189 on Bottom Layer

## Text on the board
Bottom Silkscreen Layer: IIC | SPI1
Top Silkscreen Layer: GND | +3V3 | PB13 | PB14 | PB15 | PC6 | PC7 | PC8 | PC9 | PA8 | PA9 | PA10 | PA15 | PC10 | PC11 | PC12 | PD2 | PB3 | PB4 | PB5 | PB6 | CLK | KEY1 | DIO | KEY2 | U2 | RST | SPI2 | NRST | PB12 | PB10 | PB11 | PA4 | PA7 | PA5 | PA3 | PA2 | PA0 | PC3 | PC2 | PC0 | PA6 | PB0 | PA1 | PC1 | PB1 | 串口 | 供电
